# Altium schematic sheet TPL5110 Module.SchDoc: WSN_Enviroment Monitoring System
size A; DrawnBy: Awad Shibli; Engineer: Awad Shibli; SheetNumber: 3; SheetTotal: 6
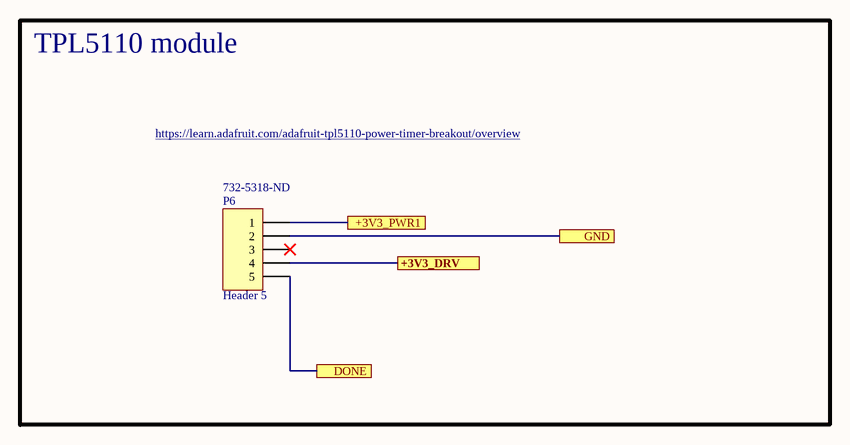
[diagram p0: TPL5110 Module.SchDoc]

## Parts
P6  Header 5  Supplier Part Number 1: 732-5318-ND  [HDR1X5]

## Blocks framed on the sheet
TPL5110 module: P6

## Ports
+3V3_DRV, +3V3_PWR1, DONE, GND

## Nets
+3V3_DRV: P6.4 ; port +3V3_DRV
+3V3_PWR1: P6.1 ; port +3V3_PWR1
DONE: P6.5 ; port DONE
GND: P6.2 ; port GND

Not connected (* = marked no-connect by the designer): P6 3*

## Notes on the sheet
- https://learn.adafruit.com/adafruit-tpl5110-power-timer-breakout/overview

## Library data of the parts
P6 = Header 5: THT Vertical Pin Header WR-PHD, Pitch 2.54 mm, Single Row, 5 pins; Manufacturer: Wurth Electronics; Manufacturer Part Number: 61300511121; Number of Positions: 5; Gender: Male; Contact Resistance: 20mR; Current Rating: 3A; Voltage Rating: 250V; Pitch: 0.1inch; LatestRevisionDate: 17-Jul-2002; LatestRevisionNote: Re-released for DXP Platform.; Publisher: Altium Limited; Supplier 1: Digikey; RoHS: Yes; Category: Headers and Wire Housings; Stock 1: 36429; Pricing 1: 1=0.26, 10=0.222, 25=0.1852, 50=0.155, 100=0.141, 1000=0.128 (USD); Mount: Through Hole; Contact Plating: Gold; Contact Material: Copper; Color: Black; Min Operating Temperature: -40°C; Max Operating Temperature: 105°C; Number of Rows: 1; Packaging: Bulk; Termination: Solder; Number of Contacts: 5; Series: WR-PHD; Contact Type: Male Pin; Orientation: 5495OrientationType; Operating Supply Voltage: 250V; Height: 8.89mm; Contact Mating Length: 0.236inch; Lead Free: Lead Free; RoHS Compliant: Yes; Reach SVHC Compliant: Unknown; ComponentLink1URL: http://www.farnell.com/cad/1737268.pdf?src-supplier=Element14; ComponentLink1Description: http://www.farnell.com/cad/1737268.pdf?src-supplier=Element14; ComponentLink2URL: https://datasheet.octopart.com/61300511121-W%C3%BCrth-Elektronik-datasheet-21154836.pdf?src-supplier=Element14; ComponentLink2Description: https://datasheet.octopart.com/61300511121-W%C3%BCrth-Elektronik-datasheet-21154836.pdf?src-supplier=Element14; ComponentLink3URL: https://katalog.we-online.de/em/datasheet/6130xx11121.pdf?src-supplier=Digikey; ComponentLink3Description: https://katalog.we-online.de/em/datasheet/6130xx11121.pdf?src-supplier=Digikey